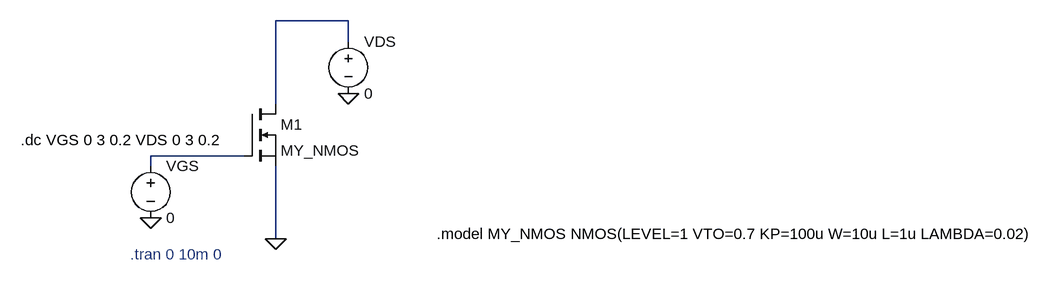
[diagram p0: schematic Draft1.asc]
Draft1.asc, the LTspice schematic file:
Version 4.1
SHEET 1 1348 680
WIRE 240 -128 128 -128
WIRE 240 -96 240 -128
WIRE 128 0 128 -128
WIRE 80 80 -64 80
WIRE -64 96 -64 80
WIRE 128 208 128 96
FLAG 240 -16 0
FLAG -64 176 0
FLAG 128 208 0
SYMBOL nmos 80 0 R0
SYMATTR InstName M1
SYMATTR Value MY_NMOS
SYMBOL voltage -64 80 R0
SYMATTR InstName VGS
SYMATTR Value 0
SYMBOL voltage 240 -112 R0
SYMATTR InstName VDS
SYMATTR Value 0
TEXT 376 200 Left 2 !.model MY_NMOS NMOS(LEVEL=1 VTO=0.7 KP=100u W=10u L=1u LAMBDA=0.02)
TEXT -96 232 Left 2 ;.tran 0 10m 0
TEXT -264 56 Left 2 !.dc VGS 0 3 0.2 VDS 0 3 0.2

The netlist it stands for:
* Draft1.asc
M1 N001 N002 0 0 MY_NMOS
VGS N002 0 0
VDS N001 0 0
.model NMOS NMOS
.model PMOS PMOS
.lib standard.mos
.model MY_NMOS NMOS(LEVEL=1 VTO=0.7 KP=100u W=10u L=1u LAMBDA=0.02)
* .tran 0 10m 0
.dc VGS 0 3 0.2 VDS 0 3 0.2
.backanno
.end